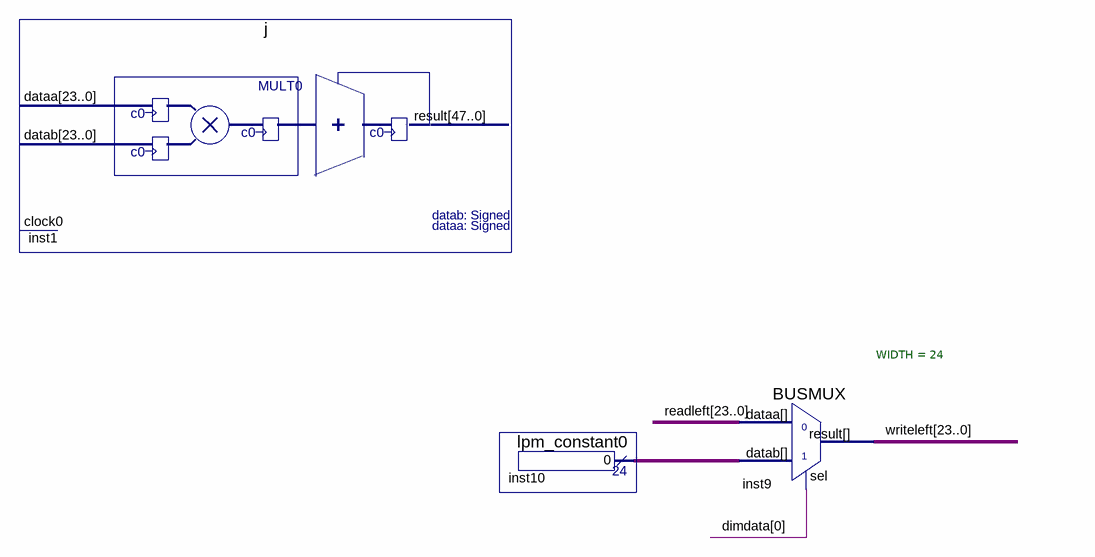
[diagram p0: schematic sheet]
// Quartus schematic extrajunk.bdf as structural Verilog: 3 symbols, 0 pins
module extrajunk (
);

  wire [0:0] dimdata;
  wire [23:0] inst10_result, readleft, writeleft;

  j inst1 ();  // open: dataa, datab, clock0, result
  lpm_constant0 inst10 (.result(inst10_result));
  BUSMUX #(.WIDTH(24)) inst9 (.datab(inst10_result), .sel(dimdata[0]), .dataa(readleft), .result(writeleft));
endmodule
